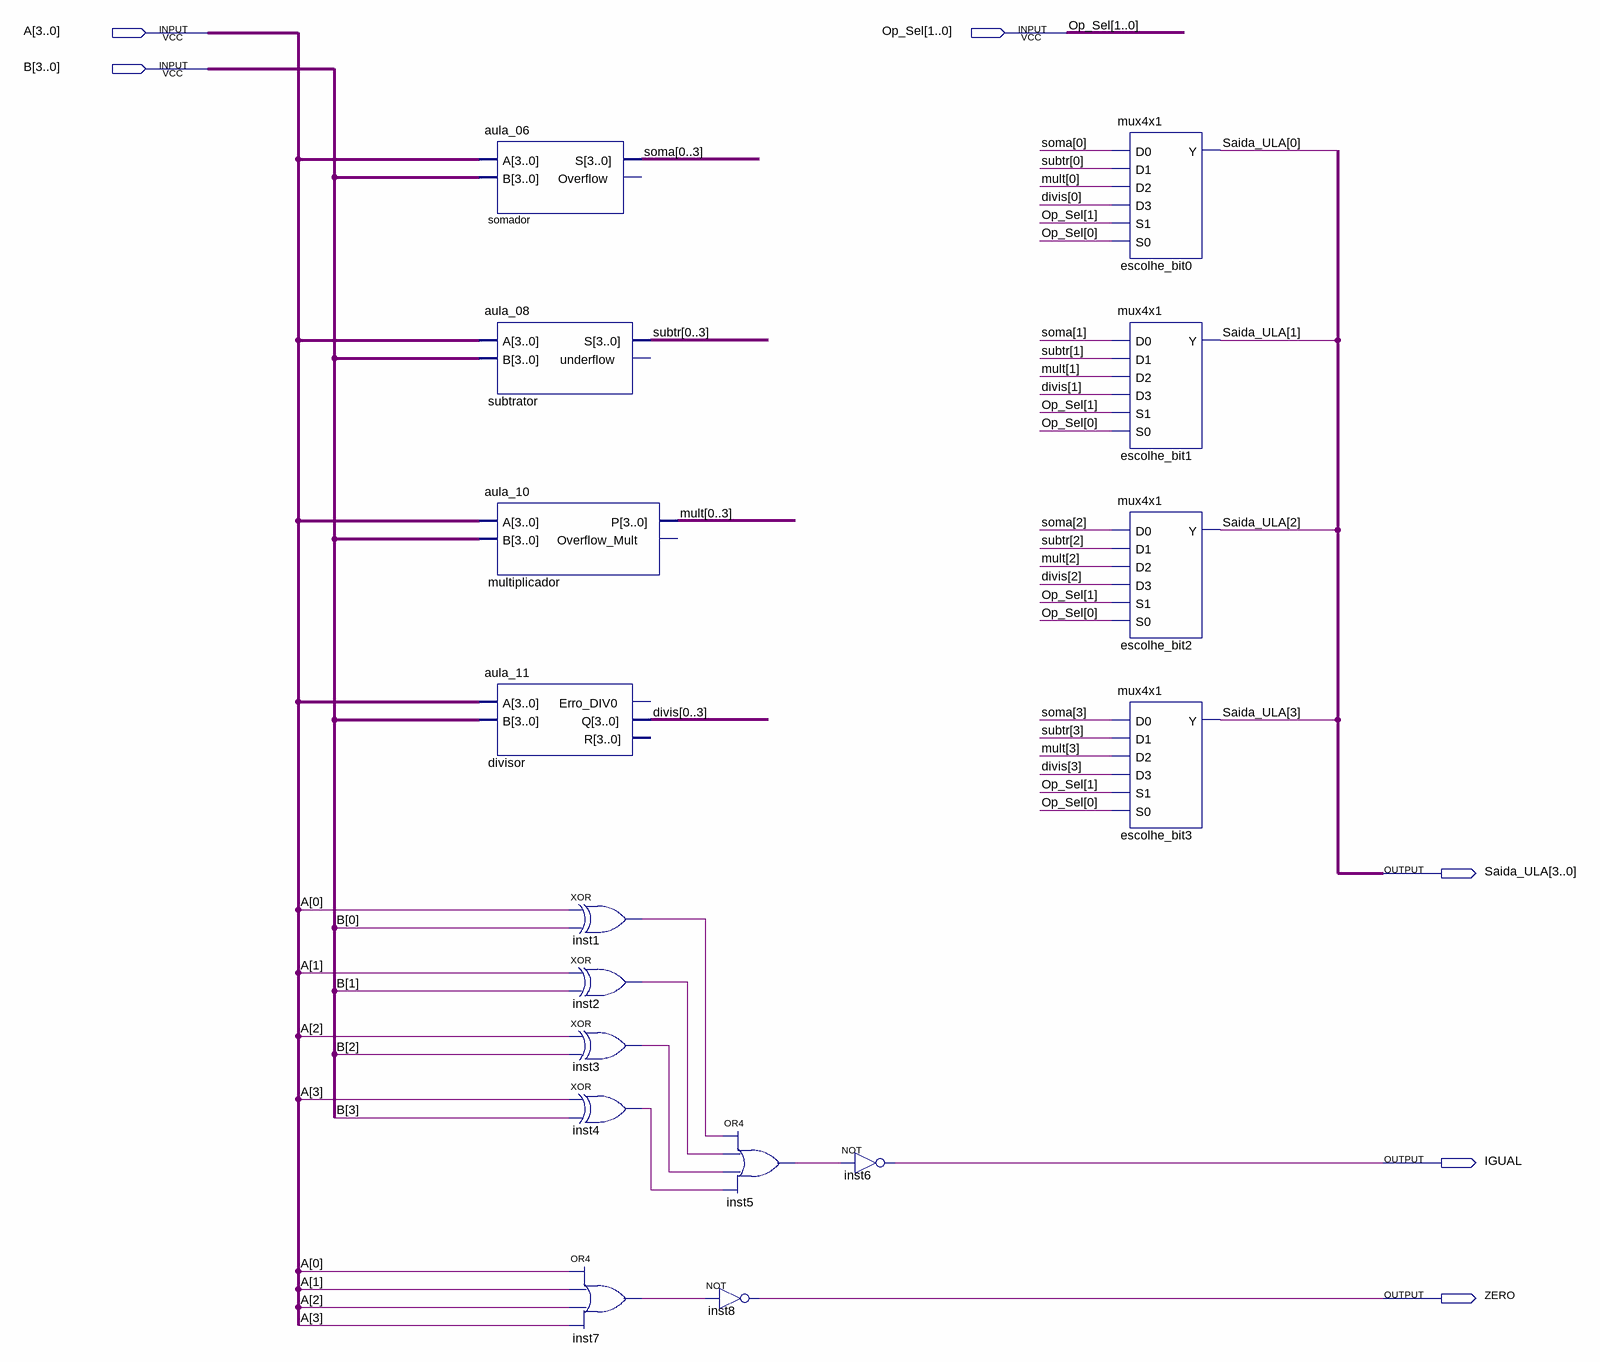
[diagram p0: schematic sheet]
// Quartus schematic ULA.bdf as structural Verilog: 16 symbols, 6 pins
module ULA (
  input  [3:0] A,
  input  [1:0] Op_Sel,
  input  [3:0] B,
  output [3:0] Saida_ULA,
  output IGUAL,
  output ZERO
);

  wire inst1_out, inst2_out, inst3_out, inst4_out, inst5_out, inst7_out;
  wire [3:0] divis, mult, soma, subtr;

  aula_06 somador (.A(A), .B(B), .S({soma[0], soma[1], soma[2], soma[3]}));  // open: Overflow
  aula_08 subtrator (.A(A), .B(B), .S({subtr[0], subtr[1], subtr[2], subtr[3]}));  // open: underflow
  aula_10 multiplicador (.A(A), .B(B), .P({mult[0], mult[1], mult[2], mult[3]}));  // open: Overflow_Mult
  aula_11 divisor (.A(A), .B(B), .Q({divis[0], divis[1], divis[2], divis[3]}));  // open: Erro_DIV0, R
  xor inst1 (inst1_out, A[0], B[0]);
  xor inst2 (inst2_out, A[1], B[1]);
  xor inst3 (inst3_out, A[2], B[2]);
  xor inst4 (inst4_out, A[3], B[3]);
  or inst7 (inst7_out, A[0], A[1], A[2], A[3]);
  or inst5 (inst5_out, inst1_out, inst2_out, inst3_out, inst4_out);
  not inst8 (ZERO, inst7_out);
  not inst6 (IGUAL, inst5_out);
  mux4x1 escolhe_bit0 (
    .D0(soma[0]), .D1(subtr[0]), .D2(mult[0]), .D3(divis[0]), .S1(Op_Sel[1]), .S0(Op_Sel[0]), .Y(Saida_ULA[0]));
  mux4x1 escolhe_bit1 (
    .D0(soma[1]), .D1(subtr[1]), .D2(mult[1]), .D3(divis[1]), .S1(Op_Sel[1]), .S0(Op_Sel[0]), .Y(Saida_ULA[1]));
  mux4x1 escolhe_bit2 (
    .D0(soma[2]), .D1(subtr[2]), .D2(mult[2]), .D3(divis[2]), .S1(Op_Sel[1]), .S0(Op_Sel[0]), .Y(Saida_ULA[2]));
  mux4x1 escolhe_bit3 (
    .D0(soma[3]), .D1(subtr[3]), .D2(mult[3]), .D3(divis[3]), .S1(Op_Sel[1]), .S0(Op_Sel[0]), .Y(Saida_ULA[3]));
endmodule
